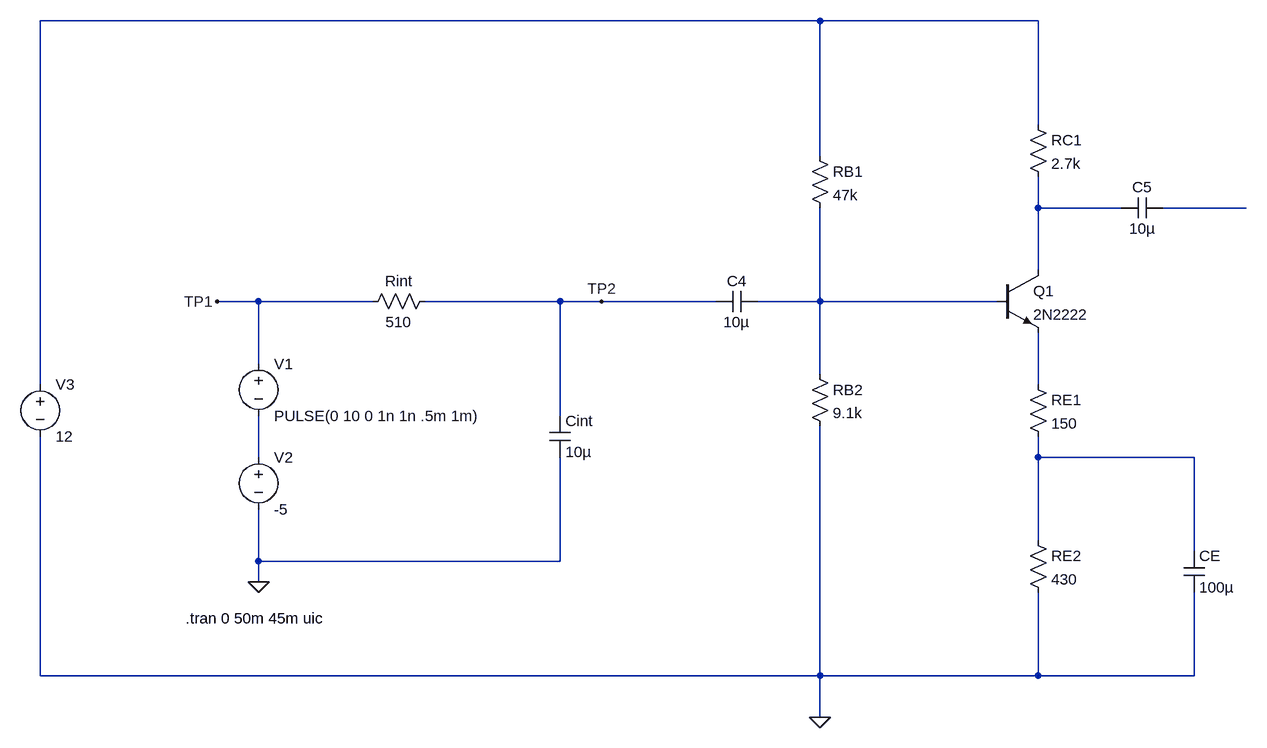
[diagram p0: schematic 3.3.asc]
3.3.asc, the LTspice schematic file:
Version 4.1
SHEET 1 1524 680
WIRE 864 -464 -336 -464
WIRE 1200 -464 864 -464
WIRE 1200 -304 1200 -464
WIRE 864 -256 864 -464
WIRE 1200 -176 1200 -224
WIRE 1328 -176 1200 -176
WIRE 1520 -176 1392 -176
WIRE 1200 -80 1200 -176
WIRE 0 -32 -64 -32
WIRE 176 -32 0 -32
WIRE 464 -32 256 -32
WIRE 528 -32 464 -32
WIRE 704 -32 528 -32
WIRE 864 -32 864 -176
WIRE 864 -32 768 -32
WIRE 1136 -32 864 -32
WIRE 0 64 0 -32
WIRE 864 80 864 -32
WIRE -336 96 -336 -464
WIRE 1200 96 1200 16
WIRE 464 144 464 -32
WIRE 0 208 0 144
WIRE 1200 208 1200 176
WIRE 1440 208 1200 208
WIRE 1200 336 1200 208
WIRE 1440 352 1440 208
WIRE 0 368 0 288
WIRE 464 368 464 208
WIRE 464 368 0 368
WIRE 0 400 0 368
WIRE -336 544 -336 176
WIRE 864 544 864 160
WIRE 864 544 -336 544
WIRE 1200 544 1200 416
WIRE 1200 544 864 544
WIRE 1440 544 1440 416
WIRE 1440 544 1200 544
WIRE 864 608 864 544
FLAG 0 400 0
FLAG -64 -32 TP1
FLAG 528 -32 TP2
FLAG 864 608 0
SYMBOL voltage 0 48 R0
WINDOW 123 0 0 Left 0
WINDOW 39 0 0 Left 0
SYMATTR InstName V1
SYMATTR Value PULSE(0 10 0 1n 1n .5m 1m)
SYMBOL res 272 -48 R90
WINDOW 0 0 56 VBottom 2
WINDOW 3 32 56 VTop 2
SYMATTR InstName Rint
SYMATTR Value 510
SYMBOL cap 448 144 R0
SYMATTR InstName Cint
SYMATTR Value 10µ
SYMBOL voltage 0 192 R0
WINDOW 123 0 0 Left 0
WINDOW 39 0 0 Left 0
SYMATTR InstName V2
SYMATTR Value -5
SYMBOL cap 768 -48 R90
WINDOW 0 0 32 VBottom 2
WINDOW 3 32 32 VTop 2
SYMATTR InstName C4
SYMATTR Value 10µ
SYMBOL npn 1136 -80 R0
SYMATTR InstName Q1
SYMATTR Value 2N2222
SYMBOL res 848 64 R0
SYMATTR InstName RB2
SYMATTR Value 9.1k
SYMBOL res 848 -272 R0
SYMATTR InstName RB1
SYMATTR Value 47k
SYMBOL res 1184 -320 R0
SYMATTR InstName RC1
SYMATTR Value 2.7k
SYMBOL cap 1392 -192 R90
WINDOW 0 0 32 VBottom 2
WINDOW 3 32 32 VTop 2
SYMATTR InstName C5
SYMATTR Value 10µ
SYMBOL res 1184 80 R0
SYMATTR InstName RE1
SYMATTR Value 150
SYMBOL res 1184 320 R0
SYMATTR InstName RE2
SYMATTR Value 430
SYMBOL cap 1424 352 R0
SYMATTR InstName CE
SYMATTR Value 100µ
SYMBOL voltage -336 80 R0
WINDOW 123 0 0 Left 0
WINDOW 39 0 0 Left 0
SYMATTR InstName V3
SYMATTR Value 12
TEXT -112 456 Left 2 !.tran 0 50m 45m uic

The netlist it stands for:
* 3.3.asc
V1 TP1 N006 PULSE(0 10 0 1n 1n .5m 1m)
Rint TP2 TP1 510
Cint TP2 0 10µ
V2 N006 0 -5
C4 N004 TP2 10µ
Q1 N002 N004 N005 0 2N2222
RB2 N004 0 9.1k
RB1 N001 N004 47k
RC1 N001 N002 2.7k
C5 N003 N002 10µ
RE1 N005 N007 150
RE2 N007 0 430
CE N007 0 100µ
V3 N001 0 12
.model NPN NPN
.model PNP PNP
.lib standard.bjt
.tran 0 50m 45m uic
.backanno
.end

* Results of the author's LTspice run, read from the files saved beside the schematic
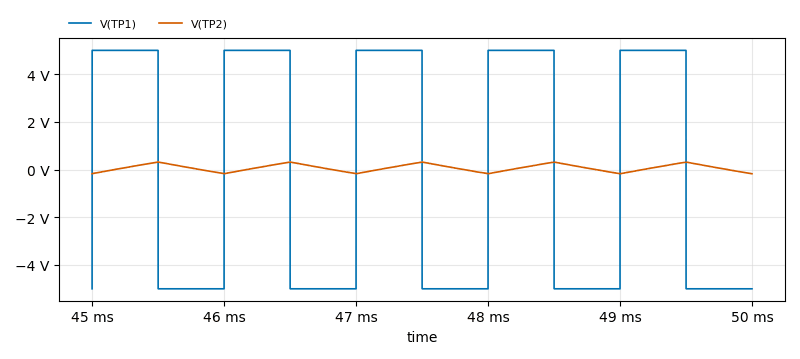
[diagram p1: Transient Analysis of 3.3.asc, plotted from the saved traces]
* Transient Analysis, 1 run:
*   V(TP1): min -5 V, max 5 V, average 10 µV, rms 5 V, last -5 V
*   V(TP2): min -176 mV, max 317.9 mV, average 71.15 mV, rms 158.5 mV, last -176 mV